# Altium schematic sheet Resolver.SchDoc: =DT_SCH_Title
size A4; Organization: Droid Technologies; SheetNumber: 12; SheetTotal: 22
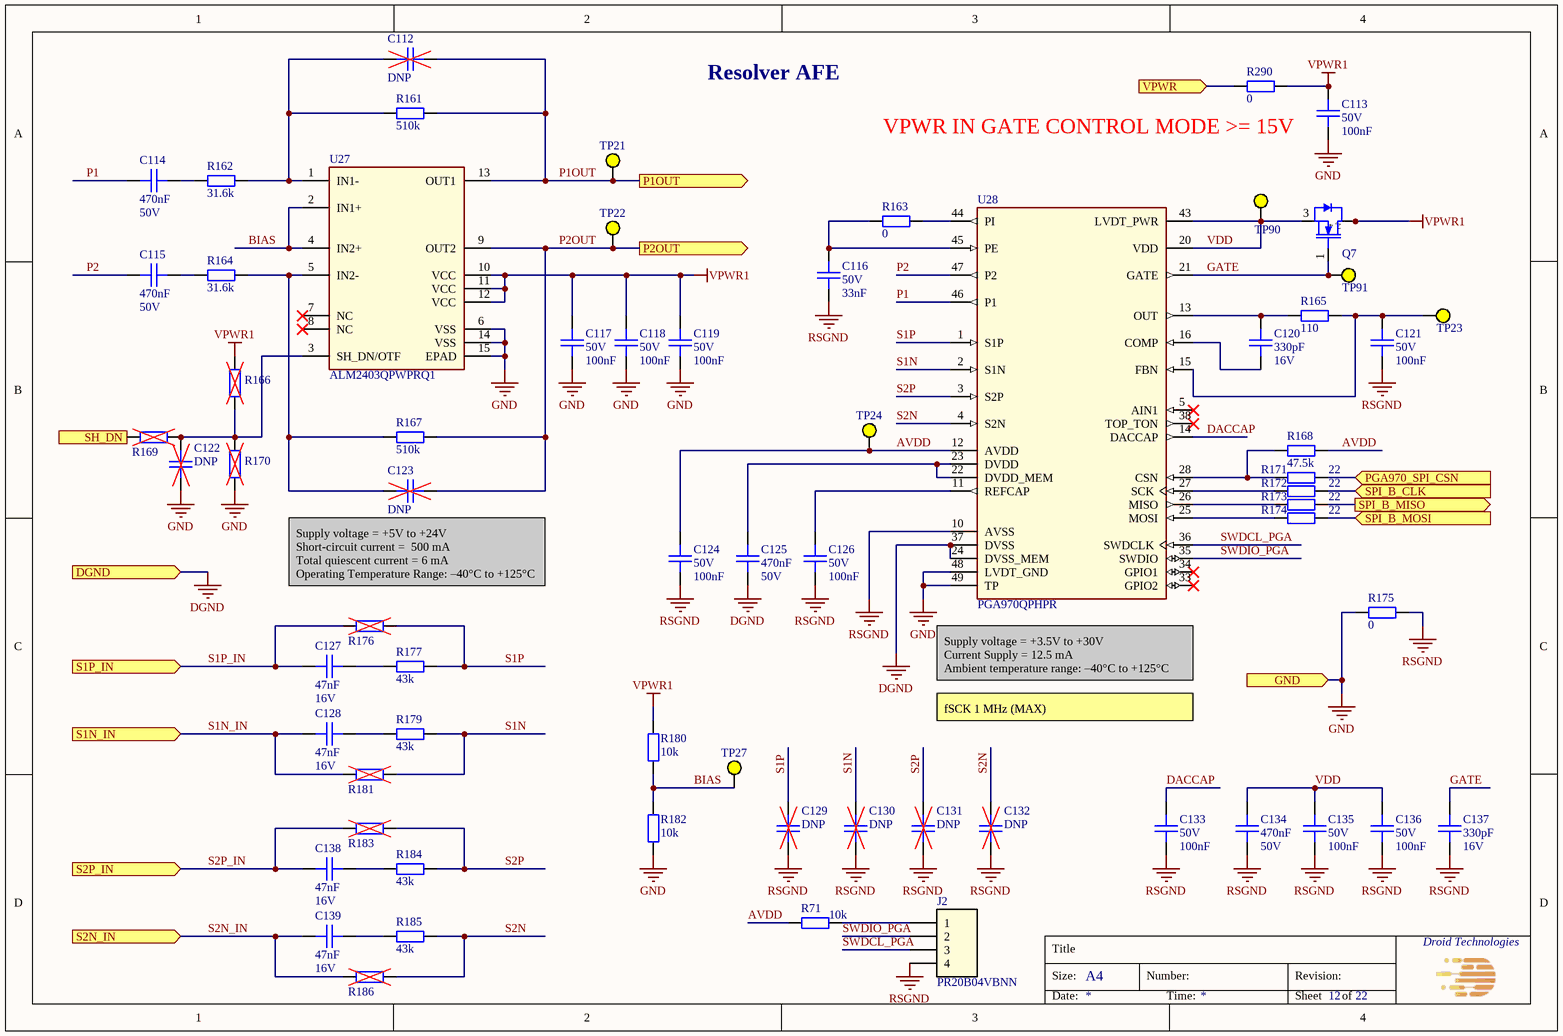
[diagram p0: Resolver.SchDoc]

## Parts
C112  Capacitance: DNP  [CAPC100x50x50L25]  (hidden comment: DNP chip cap 0402)
C113  Voltage Rating: 50V  Capacitance: 100nF  [CAPC100x50x50L25]  (hidden comment: GCM155L8EH104KE07D)
C114  Capacitance: 470nF  Voltage Rating: 50V  [CAPC200X125X145L50]  (hidden comment: CGA4J1X8L1H474K125AC)
C115  Capacitance: 470nF  Voltage Rating: 50V  [CAPC200X125X145L50]  (hidden comment: CGA4J1X8L1H474K125AC)
C116  Voltage Rating: 50V  Capacitance: 33nF  [CAPC100x50x50L25]  (hidden comment: GCM155L8EH333KE07D)
C117  Voltage Rating: 50V  Capacitance: 100nF  [CAPC100x50x50L25]  (hidden comment: GCM155L8EH104KE07D)
C118  Voltage Rating: 50V  Capacitance: 100nF  [CAPC100x50x50L25]  (hidden comment: GCM155L8EH104KE07D)
C119  Voltage Rating: 50V  Capacitance: 100nF  [CAPC100x50x50L25]  (hidden comment: GCM155L8EH104KE07D)
C120  Capacitance: 330pF  Voltage Rating: 16V  [CAPC160X80X90L35]  (hidden comment: C0603C331J4HACTU)
C121  Voltage Rating: 50V  Capacitance: 100nF  [CAPC100x50x50L25]  (hidden comment: GCM155L8EH104KE07D)
C122  Capacitance: DNP  [CAPC100x50x50L25]  (hidden comment: DNP chip cap 0402)
C123  Capacitance: DNP  [CAPC100x50x50L25]  (hidden comment: DNP chip cap 0402)
C124  Voltage Rating: 50V  Capacitance: 100nF  [CAPC100x50x50L25]  (hidden comment: GCM155L8EH104KE07D)
C125  Capacitance: 470nF  Voltage Rating: 50V  [CAPC200X125X145L50]  (hidden comment: CGA4J1X8L1H474K125AC)
C126  Voltage Rating: 50V  Capacitance: 100nF  [CAPC100x50x50L25]  (hidden comment: GCM155L8EH104KE07D)
C127  Capacitance: 47nF  Voltage Rating: 16V  [CAPC100x50x50L25]  (hidden comment: CGA2B3X8R1C473K050BB)
C128  Capacitance: 47nF  Voltage Rating: 16V  [CAPC100x50x50L25]  (hidden comment: CGA2B3X8R1C473K050BB)
C129  Capacitance: DNP  [CAPC100x50x50L25]  (hidden comment: DNP chip cap 0402)
C130  Capacitance: DNP  [CAPC100x50x50L25]  (hidden comment: DNP chip cap 0402)
C131  Capacitance: DNP  [CAPC100x50x50L25]  (hidden comment: DNP chip cap 0402)
C132  Capacitance: DNP  [CAPC100x50x50L25]  (hidden comment: DNP chip cap 0402)
C133  Voltage Rating: 50V  Capacitance: 100nF  [CAPC100x50x50L25]  (hidden comment: GCM155L8EH104KE07D)
C134  Capacitance: 470nF  Voltage Rating: 50V  [CAPC200X125X145L50]  (hidden comment: CGA4J1X8L1H474K125AC)
C135  Voltage Rating: 50V  Capacitance: 100nF  [CAPC100x50x50L25]  (hidden comment: GCM155L8EH104KE07D)
C136  Voltage Rating: 50V  Capacitance: 100nF  [CAPC100x50x50L25]  (hidden comment: GCM155L8EH104KE07D)
C137  Capacitance: 330pF  Voltage Rating: 16V  [CAPC160X80X90L35]  (hidden comment: C0603C331J4HACTU)
C138  Capacitance: 47nF  Voltage Rating: 16V  [CAPC100x50x50L25]  (hidden comment: CGA2B3X8R1C473K050BB)
C139  Capacitance: 47nF  Voltage Rating: 16V  [CAPC100x50x50L25]  (hidden comment: CGA2B3X8R1C473K050BB)
J2  PR20B04VBNN  [M50-3530442]
Q7  BSP129H6327XTSA1  [SOT230P700X180-4N]  (value not drawn)
R71  Resistance: 10k  [RESC100X50X40L25]  (hidden comment: RC0402FR-0710KL)
R161  Resistance: 510k  [RESC100X50X40L25]  (hidden comment: RC0402FR-07510KL)
R162  Resistance: 31.6k  [RESC100X50X40L25]  (hidden comment: RC0402FR-0731K6L)
R163  Resistance: 0  [RESC160X80X55L30]  (hidden comment: RC0603FR-070RL)
R164  Resistance: 31.6k  [RESC100X50X40L25]  (hidden comment: RC0402FR-0731K6L)
R165  Resistance: 110  [RESC100X50X40L25]  (hidden comment: RC0402FR-07110RL)
R166  DNP chip res 0603  [RESC160X80X55L30]  (value not drawn)
R167  Resistance: 510k  [RESC100X50X40L25]  (hidden comment: RC0402FR-07510KL)
R168  Resistance: 47.5k  [RESC100X50X40L25]  (hidden comment: RC0402FR-0747K5L)
R169  DNP chip res 0603  [RESC160X80X55L30]  (value not drawn)
R170  DNP chip res 0603  [RESC160X80X55L30]  (value not drawn)
R171  Resistance: 22  [RESC100X50X40L25]  (hidden comment: RC0402FR-0722RL)
R172  Resistance: 22  [RESC100X50X40L25]  (hidden comment: RC0402FR-0722RL)
R173  Resistance: 22  [RESC100X50X40L25]  (hidden comment: RC0402FR-0722RL)
R174  Resistance: 22  [RESC100X50X40L25]  (hidden comment: RC0402FR-0722RL)
R175  Resistance: 0  [RESC160X80X55L30]  (hidden comment: RC0603FR-070RL)
R176  DNP chip res 0603  [RESC160X80X55L30]  (value not drawn)
R177  Resistance: 43k  [RESC100X50X40L25]  (hidden comment: RC0402FR-0743KL)
R179  Resistance: 43k  [RESC100X50X40L25]  (hidden comment: RC0402FR-0743KL)
R180  Resistance: 10k  [RESC100X50X40L25]  (hidden comment: RC0402FR-0710KL)
R181  DNP chip res 0603  [RESC160X80X55L30]  (value not drawn)
R182  Resistance: 10k  [RESC100X50X40L25]  (hidden comment: RC0402FR-0710KL)
R183  DNP chip res 0603  [RESC160X80X55L30]  (value not drawn)
R184  Resistance: 43k  [RESC100X50X40L25]  (hidden comment: RC0402FR-0743KL)
R185  Resistance: 43k  [RESC100X50X40L25]  (hidden comment: RC0402FR-0743KL)
R186  DNP chip res 0603  [RESC160X80X55L30]  (value not drawn)
R290  Resistance: 0  [RESC160X80X55L30]  (hidden comment: RC0603FR-070RL)
TP21  Test Point  [TP_D0.75mm]  (value not drawn)  (no BOM)
TP22  Test Point  [TP_D0.75mm]  (value not drawn)  (no BOM)
TP23  Test Point  [TP_D1.5mm]  (value not drawn)  (no BOM)
TP24  Test Point  [TP_D0.75mm]  (value not drawn)  (no BOM)
TP27  Test Point  [TP_D0.75mm]  (value not drawn)  (no BOM)
TP90  Test Point  [TP_D1.5mm]  (value not drawn)  (no BOM)
TP91  Test Point  [TP_D1.5mm]  (value not drawn)  (no BOM)
U27  ALM2403QPWPRQ1  [14-HTSSOP]
U28  PGA970QPHPR  [48-HTQFP (7x7)]

## Ports
DGND (in), GND (in), P1OUT (out), P2OUT (out), PGA970_SPI_CSN (in), S1N_IN (in), S1P_IN (in), S2N_IN (in), S2P_IN (in), SH_DN (out), SPI_B_CLK (in), SPI_B_MISO (out), SPI_B_MOSI (in), VPWR (in)

## Nets
DGND: C125.2 U28.24(DVSS_MEM) U28.37(DVSS) ; port DGND
GND: C113.1 C117.1 C118.1 C119.1 C122.2 R170.1 R175.2 R182.1 U27.6(VSS) U27.14(VSS) U27.15(EPAD) U28.48(LVDT_GND) U28.49(TP) ; port GND
RSGND: C116.1 C121.1 C124.1 C126.1 C129.1 C130.1 C131.1 C132.1 C133.1 C134.2 C135.1 C136.1 C137.1 J2.4 R175.1 U28.10(AVSS)
VPWR1: C113.2 C117.2 C118.2 C119.2 Q7.2(DRAIN) Q7.4(DRAIN) R166.2 R180.2 R290.1 U27.10(VCC) U27.11(VCC) U27.12(VCC)
AVDD: C124.2 R71.2 R168.1 TP24.1 U28.12(AVDD)
BIAS: R180.1 R182.2 TP27.1 U27.2(IN1+) U27.4(IN2+)
DACCAP: C133.2 U28.14(DACCAP)
GATE: C137.2 Q7.1(GATE) TP91.1 U28.21(GATE)
P1: C114.2 U28.46(P1)
P1OUT: C112.1 R161.2 TP21.1 U27.13(OUT1) ; port P1OUT
P2: C115.2 U28.47(P2)
P2OUT: C123.1 R167.2 TP22.1 U27.9(OUT2) ; port P2OUT
PGA970_SPI_CSN: R171.2 ; port PGA970_SPI_CSN
S1N: C130.2 R179.2 R181.1 U28.2(S1N)
S1N_IN: C128.2 R181.2 ; port S1N_IN
S1P: C129.2 R176.1 R177.2 U28.1(S1P)
S1P_IN: C127.2 R176.2 ; port S1P_IN
S2N: C132.2 R185.2 R186.1 U28.4(S2N)
S2N_IN: C139.2 R186.2 ; port S2N_IN
S2P: C131.2 R183.1 R184.2 U28.3(S2P)
S2P_IN: C138.2 R183.2 ; port S2P_IN
SH_DN: R169.2 ; port SH_DN
SPI_B_CLK: R172.2 ; port SPI_B_CLK
SPI_B_MISO: R173.2 ; port SPI_B_MISO
SPI_B_MOSI: R174.2 ; port SPI_B_MOSI
SWDCL_PGA: J2.3 U28.36(SWDCLK)
SWDIO_PGA: J2.2 U28.35(SWDIO)
VDD: C134.1 C135.2 C136.2 Q7.3(SOURCE) TP90.1 U28.20(VDD) U28.43(LVDT_PWR)
VPWR: R290.2 ; port VPWR
NetC112_2: C112.2 R161.1 R162.2 U27.1(IN1-)
NetC114_1: C114.1 R162.1
NetC115_1: C115.1 R164.1
NetC116_2: C116.2 R163.1 U28.45(PE)
NetC120_1: C120.1 U28.16(COMP)
NetC120_2: C120.2 R165.1 U28.13(OUT)
NetC121_2: C121.2 R165.2 TP23.1 U28.15(FBN)
NetC122_1: C122.1 R166.1 R169.1 R170.2 U27.3(SH_DN/OTF)
NetC123_2: C123.2 R164.2 R167.1 U27.5(IN2-)
NetC125_1: C125.1 U28.22(DVDD_MEM) U28.23(DVDD)
NetC126_2: C126.2 U28.11(REFCAP)
NetC127_1: C127.1 R177.1
NetC128_1: C128.1 R179.1
NetC138_1: C138.1 R184.1
NetC139_1: C139.1 R185.1
NetJ2_1: J2.1 R71.1
NetR163_2: R163.2 U28.44(PI)
NetR168_2: R168.2 R171.1 U28.28(CSN)
NetR172_1: R172.1 U28.27(SCK)
NetR173_1: R173.1 U28.26(MISO)
NetR174_1: R174.1 U28.25(MOSI)

Not connected (* = marked no-connect by the designer): U27 7(NC)* 8(NC)*; U28 5(AIN1)* 33(GPIO2)* 34(GPIO1)* 38(TOP_TON)*

## Notes on the sheet
- Resolver AFE
- (near R290) VPWR IN GATE CONTROL MODE >= 15V
- Supply voltage = +5V to +24V
  Short-circuit current =  500 mA
  Total quiescent current = 6 mA
  Operating Temperature Range: –40°C to +125°C
- (near U28) Supply voltage = +3.5V to +30V
  Current Supply = 12.5 mA
  Ambient temperature range: –40°C to +125°C
- fSCK 1 MHz (MAX)
- Title
- Size:
- A4
- Number:
- Revision:
- Date:
- Time:
- Sheet
- of
- (in symbol BSP129H6327XTSA1) 2, 4

## Library data of the parts
C112 C122 C123 C129-C132 = CMP-00427-4: DNP cap 0402; Mounting Type: SM; Package: 0402 (1005 Metric); MPN: DNP
C113 C117-C119 C121 C124 C126 C133 C135 C136 = CMP-001-1980-2: CAP CER 0.1UF 50V X8L 0402; Manufacturer: Murata Electronics; Op Temp max: 150°C; Op Temp min: -55°C; Tolerance: 10%; Height max: 550µm; ComponentLink3Description: Digikey; Mounting Type: SM; ComponentLink3URL: https://www.digikey.com/en/products/detail/murata-electronics/GCM155L8EH104KE07D/11618823; Package: 0402 (1005 Metric); Lead Spacing: 0mm; MPN: GCM155L8EH104KE07D; Size: 1.00mm x 0.50mm; Ratings: AEC-Q200; ComponentLink1URL: https://www.murata.com/en-us/products/productdetail?partno=GCM155L8EH104KE07%23; ComponentLink1Description: Datasheet; Dielectric: X8L; ComponentLink2Description: Mouser; ComponentLink2URL: https://eu.mouser.com/ProductDetail/Murata-Electronics/GCM155L8EH104KE07D?qs=1mbolxNpo8fQSHf0HYnZWw%3D%3D
C114 C115 C125 C134 = CMP-001-2015-2: CAP CER 0.47UF 50V X8L 0805; Manufacturer: TDK Corporation; Op Temp min: -55°C; Tolerance: 10%; Op Temp max: 150°C; ComponentLink1Description: Datasheet; Size: 2.00mm x 1.25mm; Dielectric: X8L; ComponentLink3URL: https://www.digikey.com/en/products/detail/tdk-corporation/CGA4J1X8L1H474K125AC/12807037?s=N4IgjCBcoKxaBjKAzAhgGwM4FMA0IB7KAbRAGYYAWAdgA5KQBdfABwBcoQBlNgJwEsAdgHMQAX3xgG0EEkhoseQiRAAmMrWoamrDpG58hoieABs8WSgw58RSKTIBOMqsc6Q7TjwEjx%2BU24ycgo2yvYglAAMjpRg5sweegY%2BxviqMKoWwdZKdqSqlK5kEGmFztQgpa6xlWpllLTunvreRn7gjrSBiFaKtiqRTCaqkZTdlvI5-eGRAHQ0AAQArQBitTSRC4JrCc0gAKqC-GwA8sgAstiomACuvNjtALSZQVB8N7kqcPhujCaP4zk70%2B4QgfzEYiAA; Ratings: AEC-Q200; ComponentLink3Description: Digikey; ComponentLink2Description: Mouser; Mounting Type: SM; Lead Spacing: 0mm; ComponentLink1URL: https://product.tdk.com/en/search/capacitor/ceramic/mlcc/info?part_no=CGA4J1X8L1H474K125AC; MPN: CGA4J1X8L1H474K125AC; Height max: 1.45mm; ComponentLink2URL: https://eu.mouser.com/ProductDetail/TDK/CGA4J1X8L1H474K125AC?qs=W%2FMpXkg%252BdQ5d8zdfD6mokw%3D%3D; Package: 0805 (2012 Metric)
C116 = CMP-001-2007-2: CAP CER 0.033UF 50V X8L 0402; Manufacturer: Murata Electronics; Op Temp max: 150°C; Tolerance: 10%; Op Temp min: -55°C; ComponentLink1URL: https://www.murata.com/en-us/products/productdetail?partno=GCM155L8EH333KE07%23; Mounting Type: SM; Dielectric: X8L; ComponentLink3URL: https://www.digikey.com/en/products/detail/murata-electronics/GCM155L8EH333KE07D/17845188; Size: 1.00mm x 0.50mm; ComponentLink1Description: Datasheet; ComponentLink3Description: Digikey; Package: 0402 (1005 Metric); MPN: GCM155L8EH333KE07D; ComponentLink2Description: Mouser; Height max: 550µm; Lead Spacing: 0mm; ComponentLink2URL: https://eu.mouser.com/ProductDetail/Murata-Electronics/GCM155L8EH333KE07D?qs=rrS6PyfT74cZK6FfR7MiFw%3D%3D; Ratings: AEC-Q200
C120 C137 = CMP-001-2014-2: CAP CER 330PF 16V X8R 0603; Manufacturer: KEMET; Op Temp max: 150°C; Tolerance: 5%; Op Temp min: -55°C; ComponentLink2URL: https://eu.mouser.com/ProductDetail/KEMET/C0603C331J4HACTU?qs=W0yvOO0ixfGIN%252BOCnjHNiQ%3D%3D; MPN: C0603C331J4HACTU; Ratings: -; Height max: 870µm; ComponentLink1Description: Datasheet; ComponentLink3URL: https://www.digikey.com/en/products/detail/kemet/C0603C331J4HACTU/7946553?s=N4IgjCBcpgLFoDGUBmBDANgZwKYBoQB7KAbXAAYAOAdlgCYQBdAgBwBcoQBlNgJwEsAdgHMQAXwJ0ArA2ghkkdNnxFSIOvQCcAZgjMQ7TjwEjxBMJsqaE81JlwFikMuSYT15WNbkKlD1c4g2trkAAQsAGJMrByQIACqgvxsAPIoALI4aFgArrw4ZiAAtLJIUHw5Kk5kUiAE1ozuRd5lkBVVanpi3UA; Size: 1.60mm x 0.80mm; ComponentLink2Description: Mouser; Package: 0603 (1608 Metric); ComponentLink3Description: Digikey; Lead Spacing: 0mm; Mounting Type: SM; Dielectric: X8R; ComponentLink1URL: https://www.kemet.com/en/us/product/C0603C331J4HACTU.html
C127 C128 C138 C139 = CMP-001-2016-2: CAP CER 0.047UF 16V X8R 0402; Manufacturer: TDK Corporation; Op Temp min: -55°C; Op Temp max: 150°C; Tolerance: 10%; Lead Spacing: 0mm; ComponentLink2Description: Mouser; ComponentLink2URL: https://eu.mouser.com/ProductDetail/TDK/CGA2B3X8R1C473K050BB?qs=7GgVL%252Bg%252BDME3TQb%252Bbj%2FjaA%3D%3D; ComponentLink1Description: Datasheet; ComponentLink3URL: https://www.digikey.com/en/products/detail/tdk-corporation/CGA2B3X8R1C473K050BB/3949531; Dielectric: X8R; ComponentLink3Description: Digikey; Height max: 550µm; ComponentLink1URL: https://product.tdk.com/en/search/capacitor/ceramic/mlcc/info?part_no=CGA2B3X8R1C473K050BB; MPN: CGA2B3X8R1C473K050BB; Ratings: AEC-Q200; Size: 1.00mm x 0.50mm; Package: 0402 (1005 Metric); Mounting Type: SM
J2 = M50-3530442: Connector Header Through Hole 4 position 0.050" (1.27mm); Manufacturer: METZ CONNECT USA Inc.; MPN: PR20B04VBNN; ComponentLink1Description: Datasheet; ComponentLink1URL: https://www.lcsc.com/datasheet/C3326047.pdf; ComponentLink2Description: DigiKey; ComponentLink2URL: https://www.digikey.com/en/products/detail/metz-connect-usa-inc/PR20B04VBNN/12342910
Q7 = BSP129H6327XTSA1: MOSFET N-CH 240V 350MA SOT223-4; Manufacturer: Infineon Technologies; Current - Continuous Drain (Id) @ 25°C: 350mA (Ta); Drive Voltage (Max Rds On, Min Rds On): 0V, 10V; Rds On (Max) @ Id, Vgs: 6Ohm @ 350mA, 10V; Vgs(th) (Max) @ Id: 1V @ 108µA; Gate Charge (Qg) (Max) @ Vgs: 5.7 nC @ 5 V; Vgs (Max): ±20V; Input Capacitance (Ciss) (Max) @ Vds: 108 pF @ 25 V; Power Dissipation (Max): 1.8W (Ta); Qualification: AEC-Q101; MPN: BSP129H6327XTSA1; Drain to Source Voltage (Vdss): 240 V; ComponentLink1Description: Datasheet; ComponentLink1URL: https://www.infineon.com/assets/row/public/documents/24/49/infineon-bsp129-ds-en.pdf?fileId=db3a30433c1a8752013c1fc296d2395; Operating Temperature (MIN): -55°C (TJ); Operating Temperature (MAX): +150°C (TJ); Mounting Type: SM; Package / Case: TO-261-4, TO-261AA; ComponentLink2Description: DigiKey; ComponentLink2URL: https://www.digikey.com/en/products/detail/infineon-technologies/BSP129H6327XTSA1/5410101?s=N4IgTCBcDaIEIGUAKBGMBOAEgNgMxgHYANAFQQEEUQBdAXyA; ComponentLink3Description: Mouser; ComponentLink3URL: https://eu.mouser.com/ProductDetail/Infineon-Technologies/BSP129H6327XTSA1?qs=LqwxS8kK3AtD0Dk5QHkDTA%3D%3D
R71 R180 R182 = CMP-00010-6: RES 10K OHM 1% 1/16W 0402; Manufacturer: YAGEO; Op Temp max: 155°C; Op Temp min: -55°C; Power: 63mW; Temperature Coefficient: ±100ppm; ComponentLink3URL: https://www.digikey.com/en/products/detail/yageo/RC0402FR-0710KL/726523; ComponentLink1Description: Datasheet; Height max: 400µm; ComponentLink3Description: Digikey; ComponentLink2URL: https://www2.mouser.com/ProductDetail/YAGEO/RC0402FR-0710KL?qs=%2Fha2pyFaduhjtLcYvKXQ8NAGbRXkQ%2Fwl6RsvWHeV66MSeqLhkcF3rg%3D%3D; Ratings: -; MPN: RC0402FR-0710KL; ComponentLink1URL: https://www.yageo.com/upload/media/product/productsearch/datasheet/rchip/PYu-RC_Group_51_RoHS_L_12.pdf; ComponentLink2Description: Mouser; Mounting Type: SM; Tolerance: 1%; Composition: Thick Film; Size: 1.00mm x 0.50mm; Package: 0402 (1005 Metric)
R161 R167 = CMP-001-0533-6: RES 510K OHM 1% 1/16W 0402; Manufacturer: YAGEO; Op Temp max: 155°C; Temperature Coefficient: ±100ppm; Op Temp min: -55°C; Power: 63mW; Package: 0402 (1005 Metric); Composition: Thick Film; Size: 1.00mm x 0.50mm; ComponentLink2Description: Mouser; MPN: RC0402FR-07510KL; Height max: 400µm; ComponentLink1URL: https://www.yageo.com/upload/media/product/productsearch/datasheet/rchip/PYu-RC_Group_51_RoHS_L_12.pdf; ComponentLink2URL: https://eu.mouser.com/ProductDetail/YAGEO/RC0402FR-07510KL?qs=V1yeUXFNrkkq0IeA5n8CcA%3D%3D; Tolerance: 1%; Mounting Type: SM; ComponentLink3Description: Digikey; ComponentLink3URL: https://www.digikey.com/en/products/detail/yageo/RC0402FR-07510KL/726631; Ratings: -; ComponentLink1Description: Datasheet
R162 R164 = CMP-00475-6: RES 31.6K OHM 1% 1/16W 0402; Manufacturer: YAGEO; Power: 63mW; Temperature Coefficient: ±100ppm; Op Temp max: 155°C; Op Temp min: -55°C; ComponentLink2Description: Mouser; Size: 1.00mm x 0.50mm; ComponentLink3URL: https://www.digikey.com/en/products/detail/yageo/RC0402FR-0731K6L/5280975; Composition: Thick Film; Mounting Type: SM; ComponentLink1URL: https://www.yageo.com/upload/media/product/productsearch/datasheet/rchip/PYu-RC_Group_51_RoHS_L_12.pdf; Tolerance: 1%; ComponentLink3Description: Digikey; MPN: RC0402FR-0731K6L; ComponentLink1Description: Datasheet; Ratings: -; ComponentLink2URL: https://eu.mouser.com/ProductDetail/YAGEO/RC0402FR-0731K6L?qs=tQYgeJ5sXdm2wsAqEjplmg%3D%3D; Package: 0402 (1005 Metric); Height max: 400µm
R163 R175 R290 = CMP-001-0927-2: RES 0 OHM JUMPER 1/10W 0603; Manufacturer: YAGEO; Op Temp min: -55°C; Op Temp max: 155°C; Power: 100mW; Tolerance: 0%; Height max: 550µm; ComponentLink2URL: https://eu.mouser.com/ProductDetail/YAGEO/RC0603FR-070RL?qs=0yPvnVz5%2FmpDQv43TwvCfw%3D%3D; Temperature Coefficient: -; ComponentLink3Description: Digikey; ComponentLink2Description: Mouser; MPN: RC0603FR-070RL; ComponentLink1URL: https://www.yageo.com/upload/media/product/productsearch/datasheet/rchip/PYu-RC_Group_51_RoHS_L_12.pdf; Ratings: -; Size: 1.60mm x 0.80mm; Composition: Thick Film; Mounting Type: SM; ComponentLink3URL: https://www.digikey.com/en/products/detail/yageo/RC0603FR-070RL/1304008; Package: 0603 (1608 Metric); ComponentLink1Description: Datasheet
R165 = CMP-001-0497-6: RES 110 OHM 1% 1/16W 0402; Manufacturer: YAGEO; Power: 63mW; Op Temp min: -55°C; Op Temp max: 155°C; Temperature Coefficient: ±100ppm; Size: 1.00mm x 0.50mm; ComponentLink1Description: Datasheet; Package: 0402 (1005 Metric); ComponentLink2URL: https://eu.mouser.com/ProductDetail/YAGEO/RC0402FR-07110RL?qs=QWYorlrD8IXj7iGvwWbRbA%3D%3D; MPN: RC0402FR-07110RL; ComponentLink3Description: Digikey; Height max: 400µm; Ratings: -; ComponentLink3URL: https://www.digikey.com/en/products/detail/yageo/RC0402FR-07110RL/2827583; Composition: Thick Film; ComponentLink2Description: Mouser; Tolerance: 1%; Mounting Type: SM; ComponentLink1URL: https://www.yageo.com/upload/media/product/productsearch/datasheet/rchip/PYu-RC_Group_51_RoHS_L_12.pdf
R166 R169 R170 R176 R181 R183 R186 = CMP-001-0920-3: DNP res 0603; Mounting Type: SM; MPN: DNP; Package: 0603 (1608 Metric)
R168 = CMP-001-0277-7: RES 47.5K OHM 1% 1/16W 0402; Manufacturer: YAGEO; Op Temp min: -55°C; Power: 63mW; Temperature Coefficient: ±100ppm; Op Temp max: 155°C; ComponentLink1URL: https://www.yageo.com/upload/media/product/productsearch/datasheet/rchip/PYu-RC_Group_51_RoHS_L_12.pdf; ComponentLink1Description: Datasheet; MPN: RC0402FR-0747K5L; ComponentLink3Description: Digikey; ComponentLink2URL: https://eu.mouser.com/ProductDetail/YAGEO/RC0402FR-0747K5L?qs=V1yeUXFNrklfu86Rfgihxg%3D%3D; Mounting Type: SM; Tolerance: 1%; Package: 0402 (1005 Metric); Height max: 400µm; ComponentLink2Description: Mouser; ComponentLink3URL: https://www.digikey.com/en/products/detail/yageo/RC0402FR-0747K5L/726617; Size: 1.00mm x 0.50mm; Composition: Thick Film; Ratings: -
R171-R174 = CMP-001-0482-4: RES 22 OHM 1% 1/16W 0402; Manufacturer: YAGEO; Temperature Coefficient: ±100ppm; Op Temp max: 155°C; Op Temp min: -55°C; Power: 63mW; Ratings: -; ComponentLink3URL: https://www.digikey.com/en/products/detail/yageo/RC0402FR-0722RL/726562; ComponentLink2URL: https://eu.mouser.com/ProductDetail/YAGEO/RC0402FR-0722RL?qs=V1yeUXFNrkkRg6zf08ADKQ%3D%3D; MPN: RC0402FR-0722RL; ComponentLink1Description: Datasheet; ComponentLink3Description: Digikey; Tolerance: 1%; Size: 1.00mm x 0.50mm; ComponentLink1URL: https://www.yageo.com/upload/media/product/productsearch/datasheet/rchip/PYu-RC_Group_51_RoHS_L_12.pdf; Composition: Thick Film; ComponentLink2Description: Mouser; Mounting Type: SM; Package: 0402 (1005 Metric); Height max: 400µm
R177 R179 R184 R185 = CMP-001-0515-6: RES 43K OHM 1% 1/16W 0402; Manufacturer: YAGEO; Op Temp min: -55°C; Temperature Coefficient: ±100ppm; Power: 63mW; Op Temp max: 155°C; Size: 1.00mm x 0.50mm; Package: 0402 (1005 Metric); ComponentLink3URL: https://www.digikey.com/en/products/detail/yageo/RC0402FR-0743KL/726609; ComponentLink1Description: Datasheet; Composition: Thick Film; Mounting Type: SM; Height max: 400µm; ComponentLink2URL: https://eu.mouser.com/ProductDetail/YAGEO/RC0402FR-0743KL?qs=Is6ZsIPfHkZH7Q2ies02Tw%3D%3D; ComponentLink1URL: https://www.yageo.com/upload/media/product/productsearch/datasheet/rchip/PYu-RC_Group_51_RoHS_L_12.pdf; Ratings: -; ComponentLink2Description: Mouser; MPN: RC0402FR-0743KL; ComponentLink3Description: Digikey; Tolerance: 1%
TP21 TP22 TP24 TP27 = TP_0.75: Test point 0.75mm
TP23 TP90 TP91 = TP_1.5
U27 = ALM2403QPWPRQ1: IC OPAMP GP 2 CIRCUIT 14HTSSOP; Manufacturer: Texas Instruments; MPN: ALM2403QPWPRQ1
U28 = PGA970QPHPR: IC SGNL CONDITIONER LVDT 48HTQFP; Manufacturer: Texas Instruments; MPN: PGA970QPHPR